# Altium schematic sheet Main.SchDoc
size A4; SheetNumber: 1; SheetTotal: 7
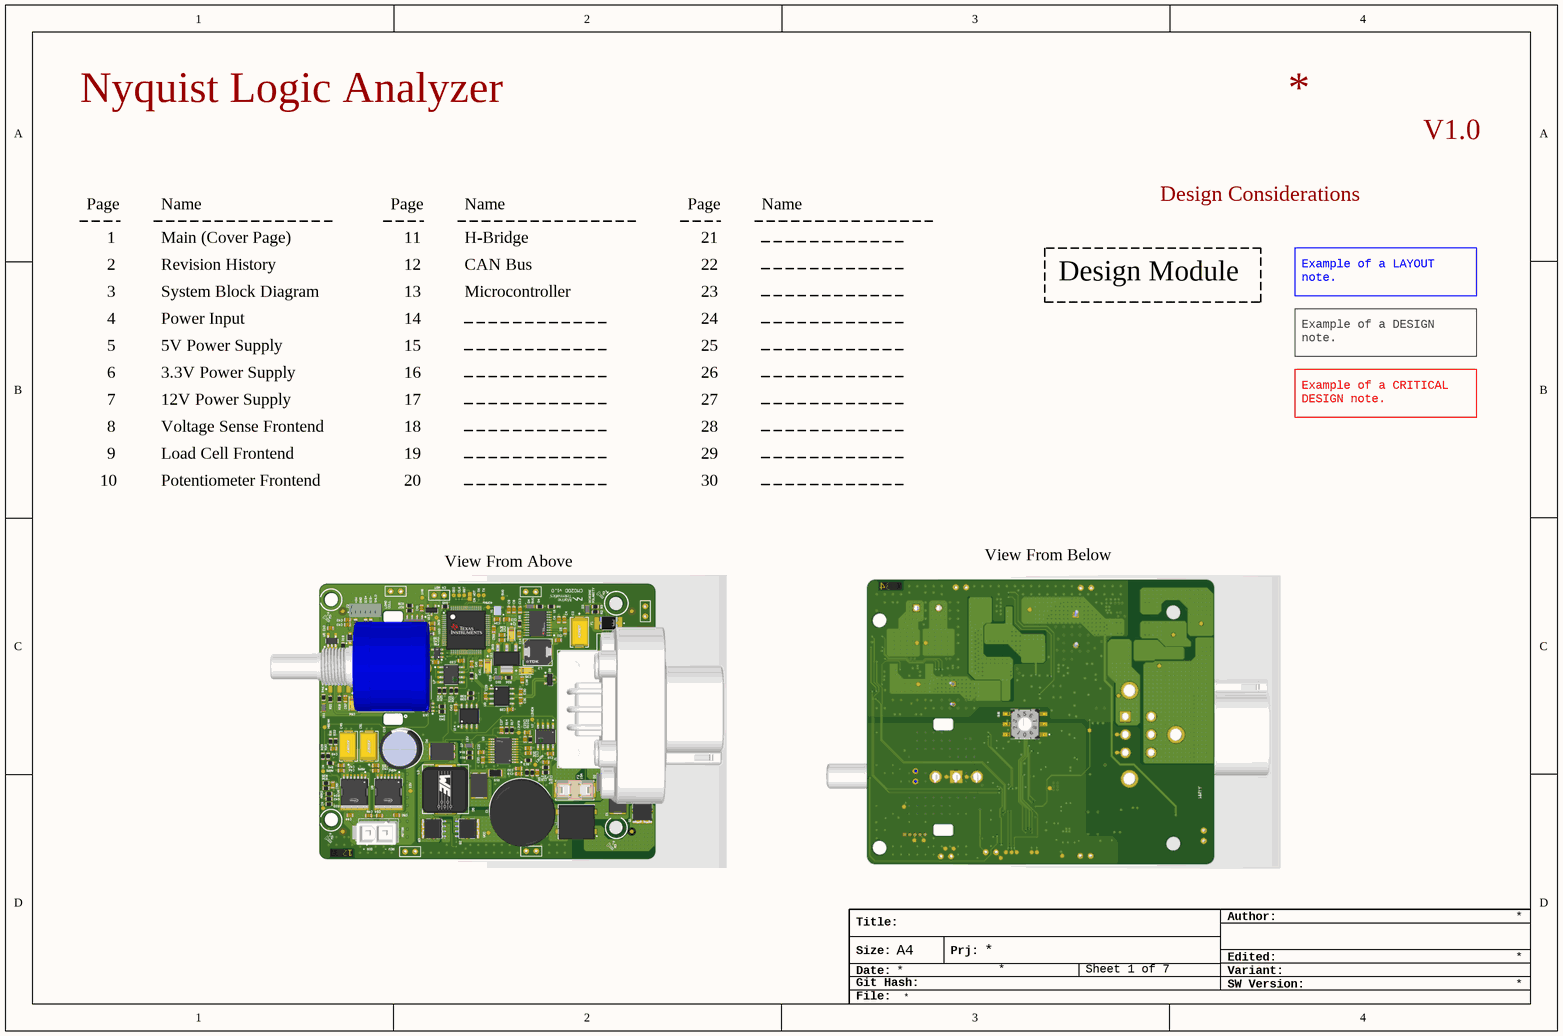
[diagram p0: Main.SchDoc]

## Notes on the sheet
- Nyquist Logic Analyzer
- V1.0
- Page
- 1
- Name
- Main (Cover Page)
- 11
- H-Bridge
- 21
- Design Considerations
- 2
- 3
- Revision History
- System Block Diagram
- 12
- 13
- CAN Bus
- Microcontroller
- 22
- 23
- Design Module
- Example of a LAYOUT note.
- 4
- 5
- 6
- Power Input
- 5V Power Supply
- 3.3V Power Supply
- 14
- 15
- 16
- 24
- 25
- 26
- Example of a DESIGN note.
- 7
- 8
- 12V Power Supply
- Voltage Sense Frontend
- 17
- 18
- 27
- 28
- Example of a CRITICAL DESIGN note.
- 10
- 9
- Load Cell Frontend
- Potentiometer Frontend
- 19
- 20
- 29
- 30
- View From Above
- View From Below
- Title:
- Author:
- Size:
- Date:
- Git Hash:
- A4
- Prj:
- SW Version:
- Variant:
- Edited:
- File: